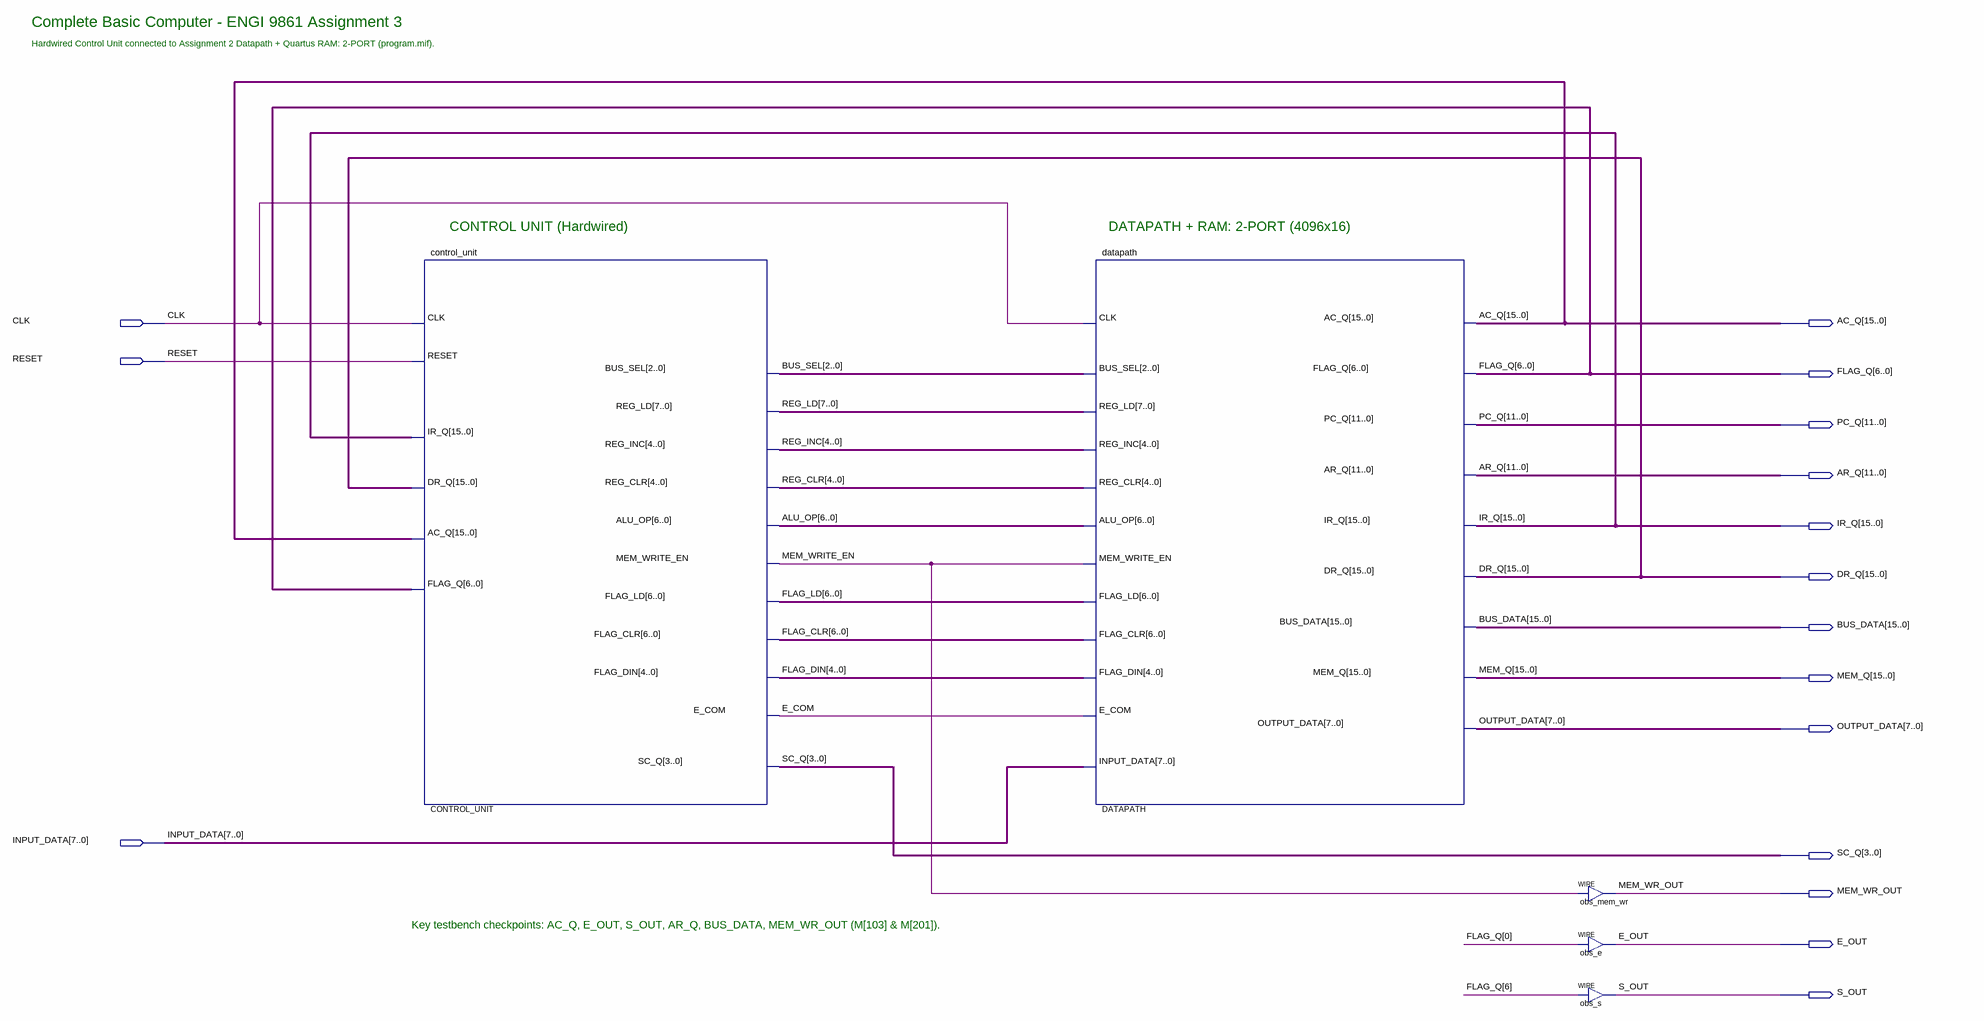
[diagram p0: schematic sheet]
// Quartus schematic basic_computer.bdf as structural Verilog: 5 symbols, 16 pins
module basic_computer (
  input  CLK,
  input  RESET,
  input  [7:0] INPUT_DATA,
  output [15:0] AC_Q,
  output [6:0] FLAG_Q,
  output [11:0] PC_Q,
  output [11:0] AR_Q,
  output [15:0] IR_Q,
  output [15:0] DR_Q,
  output [15:0] BUS_DATA,
  output [15:0] MEM_Q,
  output [7:0] OUTPUT_DATA,
  output [3:0] SC_Q,
  output MEM_WR_OUT,
  output E_OUT,
  output S_OUT
);

  wire E_COM, MEM_WRITE_EN;
  wire [2:0] BUS_SEL;
  wire [4:0] FLAG_DIN, REG_CLR, REG_INC;
  wire [6:0] ALU_OP, FLAG_CLR, FLAG_LD;
  wire [7:0] REG_LD;

  control_unit CONTROL_UNIT (
    .CLK(CLK), .RESET(RESET), .IR_Q(IR_Q), .DR_Q(DR_Q), .AC_Q(AC_Q), .FLAG_Q(FLAG_Q), .BUS_SEL(BUS_SEL),
    .REG_LD(REG_LD), .REG_INC(REG_INC), .REG_CLR(REG_CLR), .ALU_OP(ALU_OP), .MEM_WRITE_EN(MEM_WRITE_EN),
    .FLAG_LD(FLAG_LD), .FLAG_CLR(FLAG_CLR), .FLAG_DIN(FLAG_DIN), .E_COM(E_COM), .SC_Q(SC_Q));
  datapath DATAPATH (
    .CLK(CLK), .BUS_SEL(BUS_SEL), .REG_LD(REG_LD), .REG_INC(REG_INC), .REG_CLR(REG_CLR), .ALU_OP(ALU_OP),
    .MEM_WRITE_EN(MEM_WRITE_EN), .FLAG_LD(FLAG_LD), .FLAG_CLR(FLAG_CLR), .FLAG_DIN(FLAG_DIN), .E_COM(E_COM),
    .INPUT_DATA(INPUT_DATA), .AC_Q(AC_Q), .FLAG_Q(FLAG_Q), .PC_Q(PC_Q), .AR_Q(AR_Q), .IR_Q(IR_Q),
    .DR_Q(DR_Q), .BUS_DATA(BUS_DATA), .MEM_Q(MEM_Q), .OUTPUT_DATA(OUTPUT_DATA));
  assign MEM_WR_OUT = MEM_WRITE_EN;  // WIRE obs_mem_wr
  assign E_OUT = FLAG_Q[0];  // WIRE obs_e
  assign S_OUT = FLAG_Q[6];  // WIRE obs_s

  // Notes on the sheet:
  //   Complete Basic Computer - ENGI 9861 Assignment 3
  //   Hardwired Control Unit connected to Assignment 2 Datapath + Quartus RAM: 2-PORT (program.mif).
  //   CONTROL UNIT (Hardwired)
  //   DATAPATH + RAM: 2-PORT (4096x16)
  //   Key testbench checkpoints: AC_Q, E_OUT, S_OUT, AR_Q, BUS_DATA, MEM_WR_OUT (M[103] & M[201]).
endmodule
